# EAGLE design EPGcontrolFP (EAGLE 7.7.0)
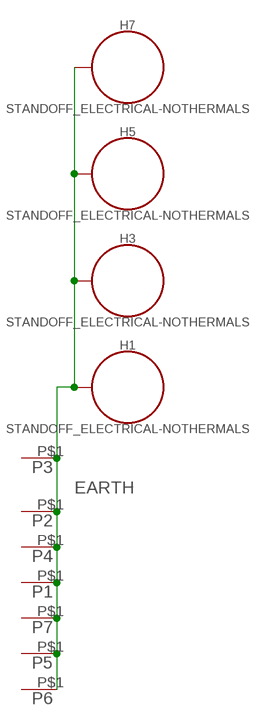
[diagram p0: schematic, sheet 1]

## Parts
H1  STANDOFF_ELECTRICAL-NOTHERMALS  [STANDOFF-ELECTRICAL-NOTHERMALS]
H3  STANDOFF_ELECTRICAL-NOTHERMALS  [STANDOFF-ELECTRICAL-NOTHERMALS]
H5  STANDOFF_ELECTRICAL-NOTHERMALS  [STANDOFF-ELECTRICAL-NOTHERMALS]
H7  STANDOFF_ELECTRICAL-NOTHERMALS  [STANDOFF-ELECTRICAL-NOTHERMALS]
P1  CON1574  [574]
P2  CON1574  [574]
P3  CON1574  [574]
P4  CON1574  [574]
P5  CON1574  [574]
P6  CON1574  [574]
P7  CON1574  [574]

## Nets
EARTH: H1.P1 H3.P1 H5.P1 H7.P1 P1.P$1 P2.P$1 P3.P$1 P4.P$1 P5.P$1 P6.P$1 P7.P$1

## Library data of the parts
H1 H3 H5 H7 = SparkFun-Hardware:STANDOFF_ELECTRICAL: Stand Off Drill holes with an electrical connection. For example, use these to ground your board to a chassis. Example SparkFun Products Screw - Phillips Head (1/4", 4-40, 10 pack) <https://www.sparkfun.com/products/10453> (PRT-10453) Screw - Phillips Head (1/2", 4-40, 10 pack) <https://www.sparkfun.com/products/10452> (PRT-10452) Screw - Phillips Head (3/4", 4-40, 10 pack) <https://www.sparkfun.com/products/10451> (PRT-10451) Screw - Phillips Head (1", 4-40, 10 pack) <https://www.sparkfun.com/products/10450> (PRT-10450)
P1-P7 = STEVES_BU:CON1

## Board
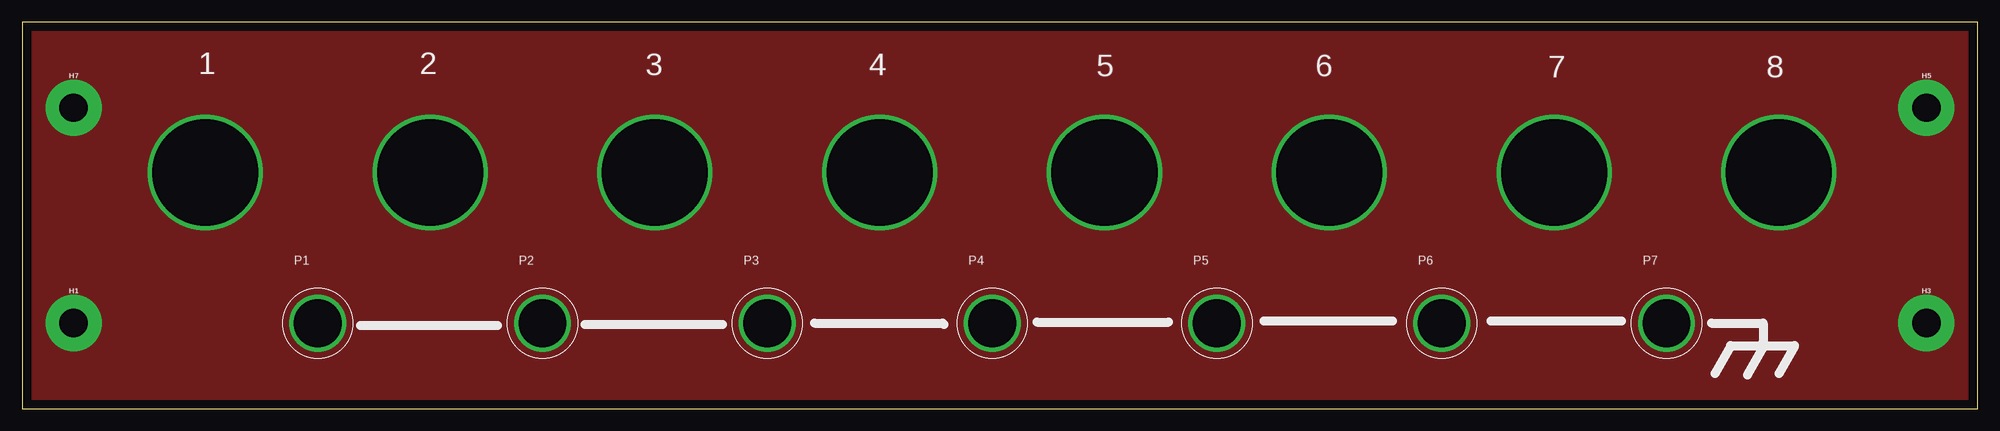
[diagram p1: board, top side]
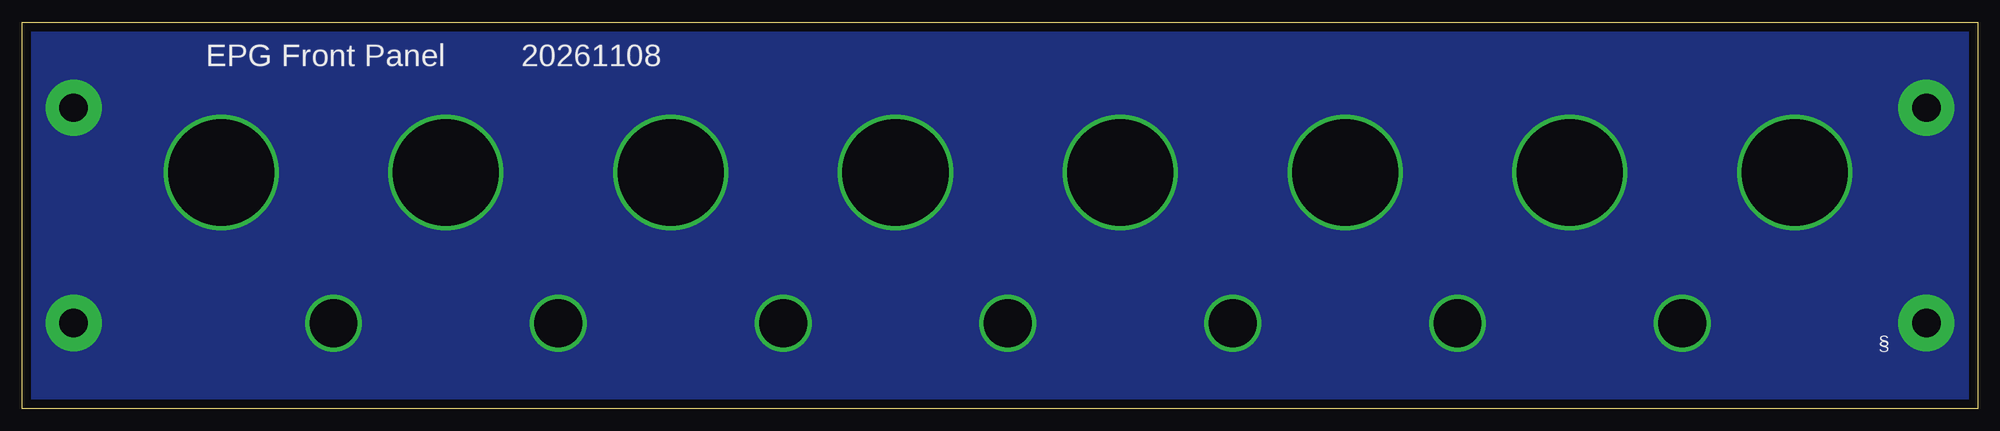
[diagram p2: board, bottom side, seen from below]

Size 220.98 x 43.66 mm. Coordinates in mm from the lower left corner, seen from the top.
Outline: 0,0 220.98,0 220.98,43.66 0,43.66 0,0
Copper layers (1*16): Top 0.035mm / dielectric 1.5mm / Bottom 0.035mm
Design rules "default *": minimum track width 10mil, minimum drill 10mil, track to track 8mil, track to pad 7mil, pad to pad 7mil, via to via 8mil, smd to smd 8mil, copper to edge 40mil, drill to drill 8mil, minimum pad ring 10mil, minimum via ring 8mil, stop-mask expansion 4mil, vias tented up to drill 0mil, thermal gap 10mil

### Footprints (pad centres in the part's own frame; a part is rotated, then mirrored left to right if it is on the bottom)
STANDOFF-ELECTRICAL-NOTHERMALS = drill 3.2 pad 6.35: P1 0,0
574 = drill 5.41: P$1 0,0

### Placement (x,y rotation side)
H1  5.82,9.68 0 top
H3  215.16,9.68 0 top
H5  215.16,33.99 0 top
H7  5.82,33.99 0 top
P1  33.4,9.65 0 top
P2  58.8,9.65 0 top
P3  84.2,9.65 0 top
P4  109.6,9.65 0 top
P5  135,9.65 0 top
P6  160.4,9.65 0 top
P7  185.8,9.65 0 top

### Tracks (layer width: path | path; a pad name or v marks a point on that pad's centre or on a via)
EARTH  (via drill 11.99)
  other vias: 20.7,26.67 46.1,26.67 71.5,26.67 96.9,26.67 122.3,26.67 147.7,26.67 173.1,26.67 198.5,26.67
  pour Bottom (no thermals): -1.02,44.07 -1.02,-2.03 222.12,-2.03 222.12,44.07
  pour Top (no thermals): -1.02,44.83 -1.02,-2.41 222.5,-2.41 222.5,44.83

### Text on the board
tPlace: 1 | 2 | 3 | 4 | 5 | 6 | 7 | 8
bPlace: 20261108 | EPG Front Panel | S | S